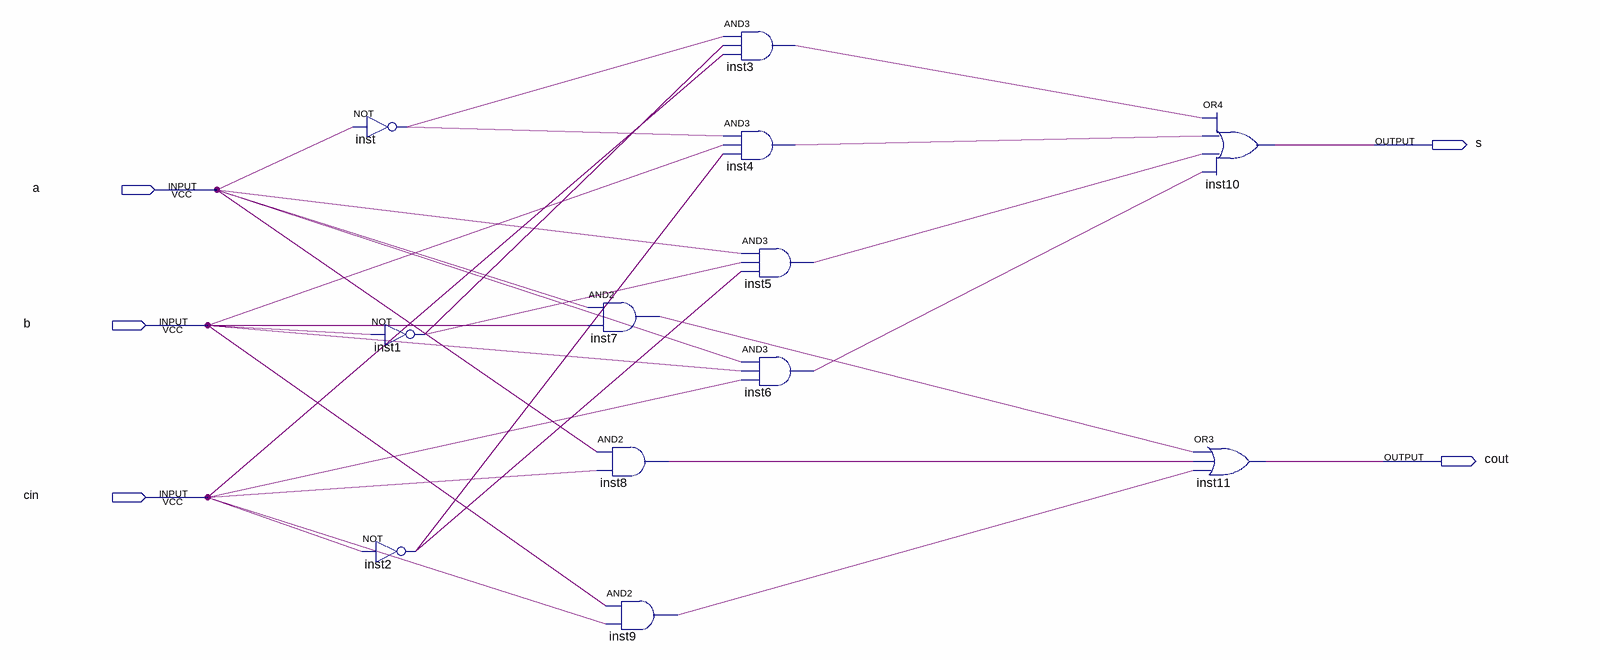
[diagram p0: schematic sheet]
// Quartus schematic adder.bdf as structural Verilog: 12 symbols, 5 pins
module adder (
  input  a,
  input  b,
  input  cin,
  output s,
  output cout
);

  wire inst1_out, inst2_out, inst3_out, inst4_out, inst5_out, inst6_out, inst7_out, inst8_out, inst9_out,
       inst_out;

  not inst (inst_out, a);
  not inst1 (inst1_out, b);
  not inst2 (inst2_out, cin);
  and inst7 (inst7_out, a, b);
  and inst8 (inst8_out, a, cin);
  and inst9 (inst9_out, b, cin);
  and inst3 (inst3_out, inst_out, inst1_out, cin);
  and inst4 (inst4_out, inst_out, b, inst2_out);
  and inst5 (inst5_out, a, inst1_out, inst2_out);
  and inst6 (inst6_out, a, b, cin);
  or inst10 (s, inst3_out, inst4_out, inst5_out, inst6_out);
  or inst11 (cout, inst7_out, inst8_out, inst9_out);
endmodule
